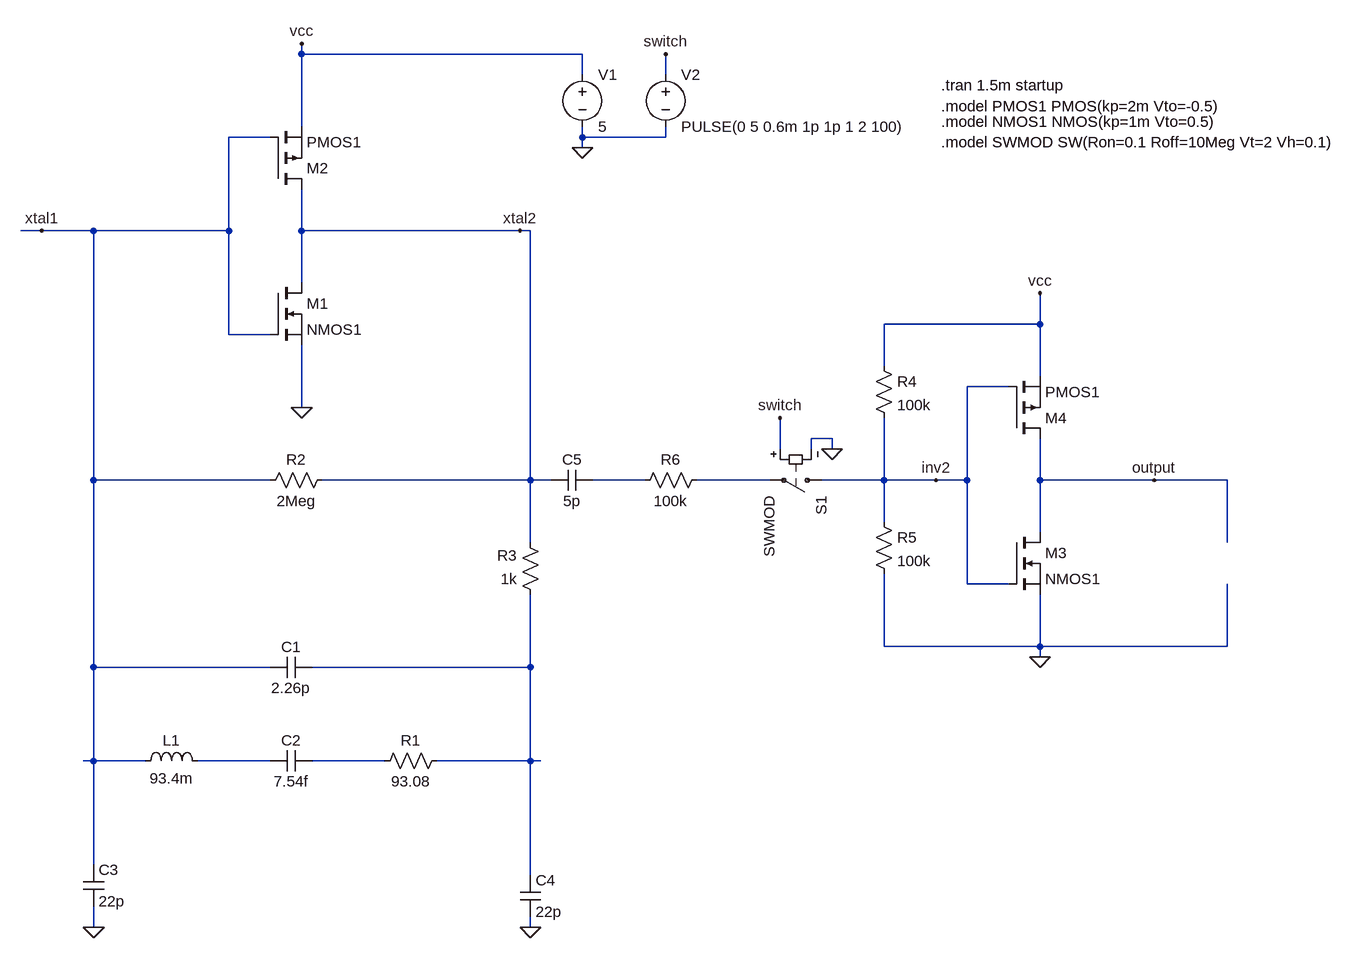
[diagram p0: schematic oscilador_unit1.asc]
oscilador_unit1.asc, the LTspice schematic file:
Version 4.1
SHEET 1 2804 1576
WIRE 1152 192 1152 176
WIRE 1584 192 1152 192
WIRE 1584 224 1584 192
WIRE 1712 224 1712 192
WIRE 1152 304 1152 192
WIRE 1104 320 1040 320
WIRE 1584 320 1584 304
WIRE 1712 320 1712 304
WIRE 1712 320 1584 320
WIRE 1584 336 1584 320
WIRE 752 464 720 464
WIRE 832 464 752 464
WIRE 1040 464 1040 320
WIRE 1040 464 832 464
WIRE 1152 464 1152 400
WIRE 1488 464 1152 464
WIRE 1504 464 1488 464
WIRE 1152 544 1152 464
WIRE 2288 608 2288 560
WIRE 2288 608 2048 608
WIRE 1040 624 1040 464
WIRE 1104 624 1040 624
WIRE 2048 672 2048 608
WIRE 2288 688 2288 608
WIRE 2240 704 2176 704
WIRE 1152 736 1152 640
WIRE 1968 784 1936 784
WIRE 1888 800 1888 752
WIRE 1936 800 1936 784
WIRE 1968 800 1968 784
WIRE 832 848 832 464
WIRE 1104 848 832 848
WIRE 1504 848 1504 464
WIRE 1504 848 1184 848
WIRE 1536 848 1504 848
WIRE 1680 848 1600 848
WIRE 1872 848 1760 848
WIRE 2048 848 2048 752
WIRE 2048 848 1952 848
WIRE 2128 848 2048 848
WIRE 2176 848 2176 704
WIRE 2176 848 2128 848
WIRE 2288 848 2288 784
WIRE 2464 848 2288 848
WIRE 2576 848 2464 848
WIRE 2048 912 2048 848
WIRE 2288 928 2288 848
WIRE 1504 944 1504 848
WIRE 2576 944 2576 848
WIRE 2176 1008 2176 848
WIRE 2240 1008 2176 1008
WIRE 2048 1104 2048 992
WIRE 2288 1104 2288 1024
WIRE 2288 1104 2048 1104
WIRE 2576 1104 2576 1008
WIRE 2576 1104 2288 1104
WIRE 2288 1120 2288 1104
WIRE 832 1136 832 848
WIRE 1104 1136 832 1136
WIRE 1504 1136 1504 1024
WIRE 1504 1136 1168 1136
WIRE 832 1280 832 1136
WIRE 832 1280 816 1280
WIRE 912 1280 832 1280
WIRE 1104 1280 992 1280
WIRE 1280 1280 1168 1280
WIRE 1504 1280 1504 1136
WIRE 1504 1280 1360 1280
WIRE 1520 1280 1504 1280
WIRE 832 1440 832 1280
WIRE 1504 1456 1504 1280
WIRE 832 1536 832 1504
WIRE 1504 1536 1504 1520
FLAG 832 1536 0
FLAG 1504 1536 0
FLAG 1152 736 0
FLAG 1152 176 vcc
FLAG 1584 336 0
FLAG 752 464 xtal1
FLAG 1488 464 xtal2
FLAG 2288 1120 0
FLAG 2288 560 vcc
FLAG 2464 848 output
FLAG 2128 848 inv2
FLAG 1712 192 switch
FLAG 1968 800 0
FLAG 1888 752 switch
SYMBOL cap 1168 1120 R90
WINDOW 0 0 32 VBottom 2
WINDOW 3 32 32 VTop 2
SYMATTR InstName C1
SYMATTR Value 2.26p
SYMBOL res 1376 1264 R90
WINDOW 0 0 56 VBottom 2
WINDOW 3 32 56 VTop 2
SYMATTR InstName R1
SYMATTR Value 93.08
SYMBOL cap 1168 1264 R90
WINDOW 0 0 32 VBottom 2
WINDOW 3 32 32 VTop 2
SYMATTR InstName C2
SYMATTR Value 7.54f
SYMBOL ind 896 1296 R270
WINDOW 0 32 56 VTop 2
WINDOW 3 5 56 VBottom 2
SYMATTR InstName L1
SYMATTR Value 93.4m
SYMATTR SpiceLine Rser=1m
SYMBOL cap 816 1440 R0
SYMATTR InstName C3
SYMATTR Value 22p
SYMBOL cap 1488 1456 R0
SYMATTR InstName C4
SYMATTR Value 22p
SYMBOL nmos 1104 544 R0
SYMATTR InstName M1
SYMATTR Value NMOS1
SYMBOL pmos 1104 400 M180
SYMATTR InstName M2
SYMATTR Value PMOS1
SYMBOL voltage 1584 208 R0
WINDOW 123 0 0 Left 0
WINDOW 39 0 0 Left 0
SYMATTR InstName V1
SYMATTR Value 5
SYMBOL res 1200 832 R90
WINDOW 0 0 56 VBottom 2
WINDOW 3 32 56 VTop 2
SYMATTR InstName R2
SYMATTR Value 2Meg
SYMBOL res 1520 1040 R180
WINDOW 0 36 76 Left 2
WINDOW 3 36 40 Left 2
SYMATTR InstName R3
SYMATTR Value 1k
SYMBOL nmos 2240 928 R0
SYMATTR InstName M3
SYMATTR Value NMOS1
SYMBOL pmos 2240 784 M180
SYMATTR InstName M4
SYMATTR Value PMOS1
SYMBOL res 2032 656 R0
SYMATTR InstName R4
SYMATTR Value 100k
SYMBOL res 2032 896 R0
SYMATTR InstName R5
SYMATTR Value 100k
SYMBOL cap 1600 832 R90
WINDOW 0 0 32 VBottom 2
WINDOW 3 32 32 VTop 2
SYMATTR InstName C5
SYMATTR Value 5p
SYMBOL res 1776 832 R90
WINDOW 0 0 56 VBottom 2
WINDOW 3 32 56 VTop 2
SYMATTR InstName R6
SYMATTR Value 100k
SYMBOL sw 1968 848 R90
SYMATTR InstName S1
SYMATTR Value SWMOD
SYMBOL voltage 1712 208 R0
WINDOW 123 0 0 Left 0
WINDOW 39 0 0 Left 0
SYMATTR InstName V2
SYMATTR Value PULSE(0 5 0.6m 1p 1p 1 2 100)
TEXT 2136 272 Left 2 !.model PMOS1 PMOS(kp=2m Vto=-0.5)
TEXT 2136 296 Left 2 !.model NMOS1 NMOS(kp=1m Vto=0.5)
TEXT 2136 240 Left 2 !.tran 1.5m startup
TEXT 2136 328 Left 2 !.model SWMOD SW(Ron=0.1 Roff=10Meg Vt=2 Vh=0.1)

The netlist it stands for:
* oscilador_unit1.asc
C1 N003 xtal1 2.26p
R1 N003 N005 93.08
C2 N005 N004 7.54f
L1 xtal1 N004 93.4m Rser=1m
C3 xtal1 0 22p
C4 N003 0 22p
M1 xtal2 xtal1 0 0 NMOS1
M2 xtal2 xtal1 vcc vcc PMOS1
V1 vcc 0 5
R2 xtal2 xtal1 2Meg
R3 N003 xtal2 1k
M3 output inv2 0 0 NMOS1
M4 output inv2 vcc vcc PMOS1
R4 vcc inv2 100k
R5 inv2 0 100k
C5 N001 xtal2 5p
R6 N002 N001 100k
S1 inv2 N002 switch 0 SWMOD
V2 switch 0 PULSE(0 5 0.6m 1p 1p 1 2 100)
.model NMOS NMOS
.model PMOS PMOS
.lib standard.mos
.model PMOS1 PMOS(kp=2m Vto=-0.5)
.model NMOS1 NMOS(kp=1m Vto=0.5)
.tran 1.5m startup
.model SWMOD SW(Ron=0.1 Roff=10Meg Vt=2 Vh=0.1)
.backanno
.end